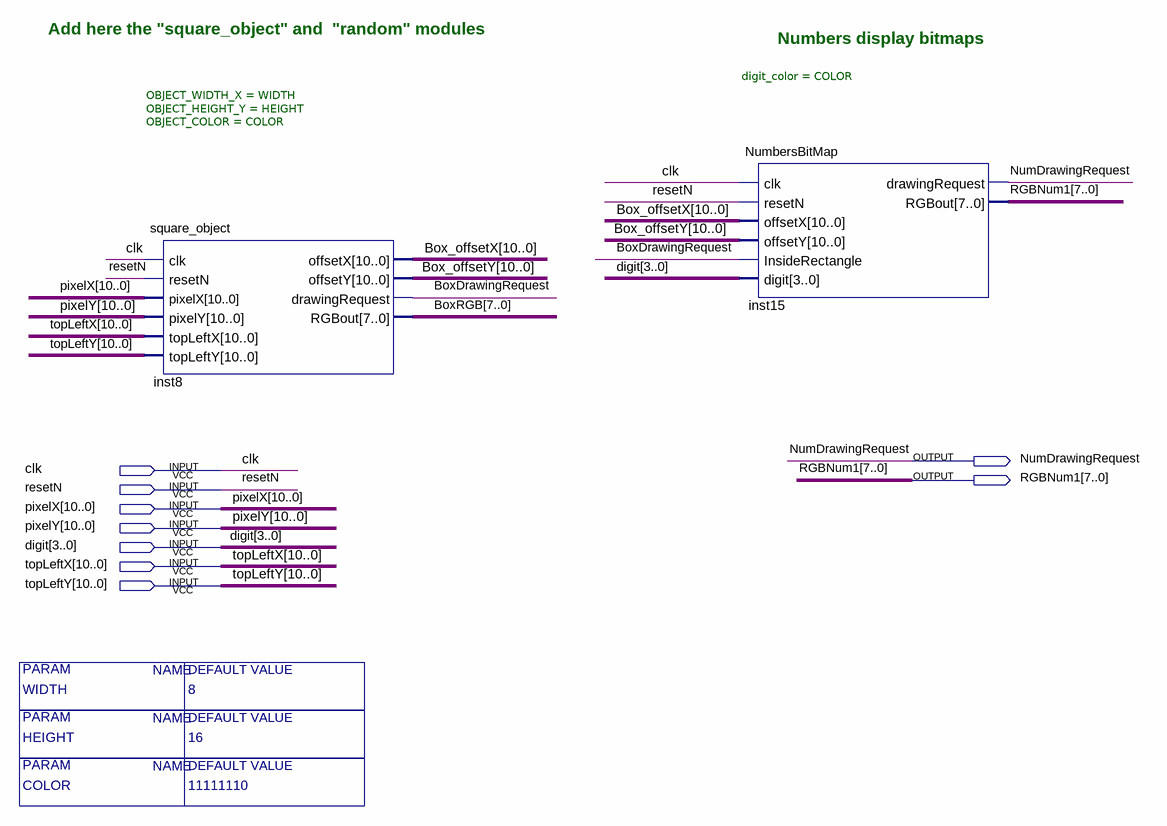
[diagram p0: schematic sheet]
// Quartus schematic Number.bdf as structural Verilog: 2 symbols, 9 pins
module Number #(parameter COLOR = 11111110, parameter WIDTH = 8, parameter HEIGHT = 16) (
  input  clk,
  input  resetN,
  input  [10:0] pixelX,
  input  [10:0] pixelY,
  input  [3:0] digit,
  input  [10:0] topLeftX,
  input  [10:0] topLeftY,
  output NumDrawingRequest,
  output [7:0] RGBNum1
);

  wire BoxDrawingRequest;
  wire [7:0] BoxRGB;
  wire [10:0] Box_offsetX, Box_offsetY;

  square_object #(.OBJECT_WIDTH_X(WIDTH), .OBJECT_HEIGHT_Y(HEIGHT), .OBJECT_COLOR(COLOR)) inst8 (
    .clk(clk), .resetN(resetN), .pixelX(pixelX), .pixelY(pixelY), .topLeftX(topLeftX), .topLeftY(topLeftY),
    .offsetX(Box_offsetX), .offsetY(Box_offsetY), .drawingRequest(BoxDrawingRequest), .RGBout(BoxRGB));
  NumbersBitMap #(.digit_color(COLOR)) inst15 (
    .clk(clk), .resetN(resetN), .offsetX(Box_offsetX), .offsetY(Box_offsetY),
    .InsideRectangle(BoxDrawingRequest), .digit(digit), .drawingRequest(NumDrawingRequest), .RGBout(RGBNum1));

  // Notes on the sheet:
  //   Add here the "square_object" and  "random" modules
  //   Numbers display bitmaps
endmodule
